# Altium schematic sheet Sheet5.SchDoc
size A; SheetNumber: 6; SheetTotal: 10
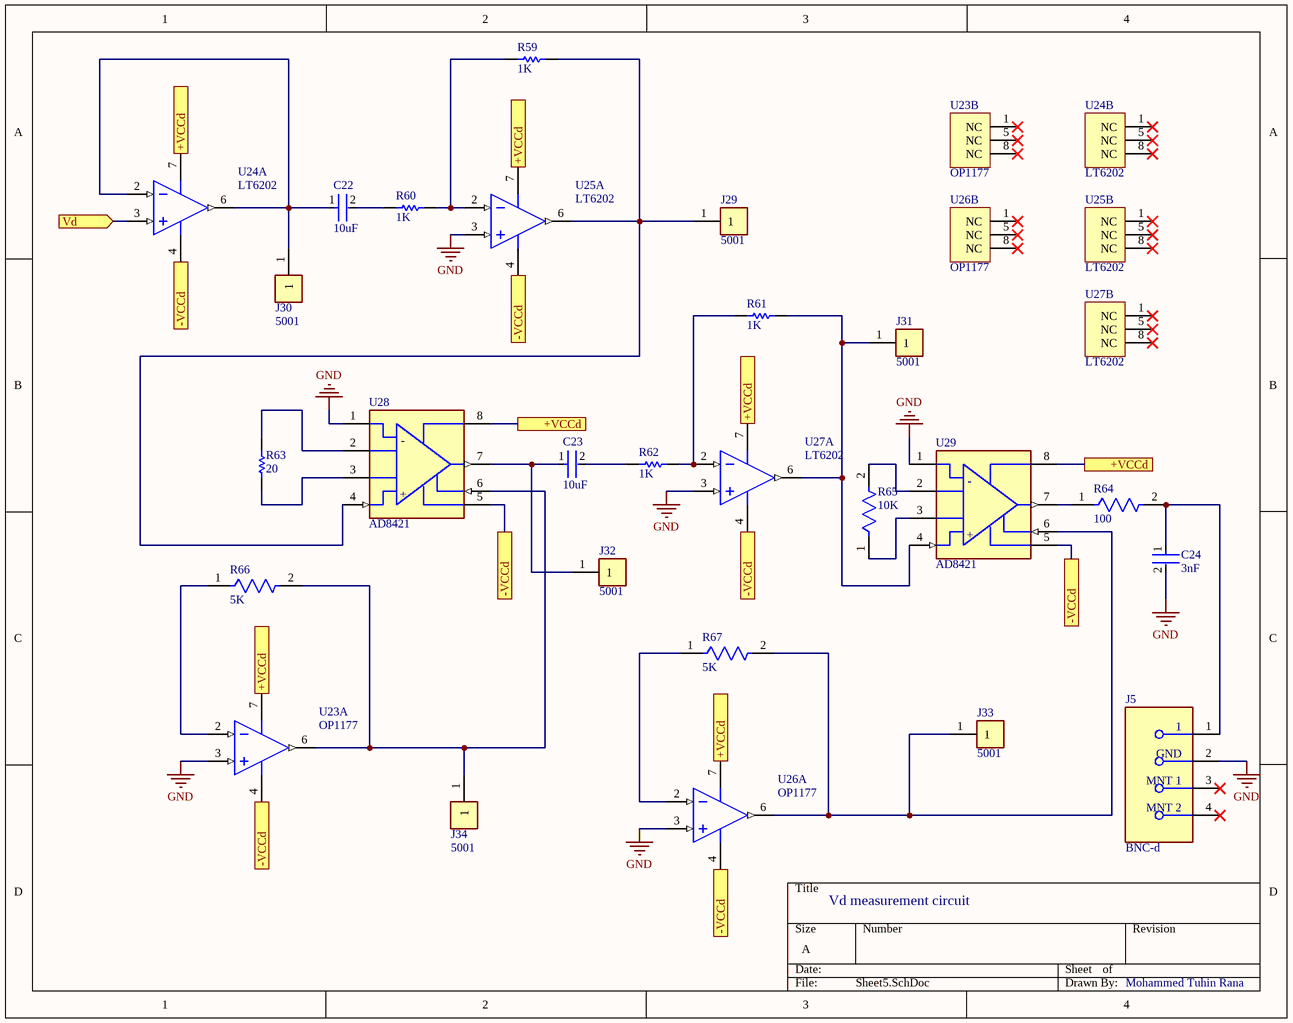
[diagram p0: Sheet5.SchDoc]

## Parts
C22  10uF  [FP-GRM21B-0_1-IPC_C]
C23  10uF  [FP-GRM21B-0_1-IPC_C]
C24  3nF  [FP-C1206C-EB-MFG]
J5  BNC-d  [FP-5413194-2-MFG]
J29  5001  [FP-5001-MFG]
J30  5001  [FP-5001-MFG]
J31  5001  [FP-5001-MFG]
J32  5001  [FP-5001-MFG]
J33  5001  [FP-5001-MFG]
J34  5001  [FP-5001-MFG]
R59  1K  [RESC3216X70X50ML20T25]
R60  1K  [RESC3216X70X50ML20T25]
R61  1K  [RESC3216X70X50ML20T25]
R62  1K  [RESC3216X70X50ML20T25]
R63  20  [RESC3216X60X45ML10T20]
R64  100  [FP-ERA3A-IPC_B]
R65  10K  [FP-ERJPA3-IPC_A]
R66  5K  [FP-RT1206-0_65-MFG]
R67  5K  [FP-RT1206-0_65-MFG]
U23  OP1177  [ADI-R-8_N]  (parts A,B of 2)
U24  LT6202  [LT-S8-8_N]  (parts A,B of 2)
U25  LT6202  [LT-S8-8_N]  (parts A,B of 2)
U26  OP1177  [ADI-R-8_N]  (parts A,B of 2)
U27  LT6202  [LT-S8-8_N]  (parts A,B of 2)
U28  AD8421  [FP-R-8-IPC_C]
U29  AD8421  [FP-R-8-IPC_C]

## Ports
+VCCd (see Sheet5[1A], Sheet5[1C], Sheet5[2A], Sheet5[2B], Sheet5[3B], Sheet5[3C], Sheet10[4B]), +VCCd (see Sheet5[1A], Sheet5[1C], Sheet5[2A], Sheet5[2B], Sheet5[3B], Sheet5[4B], Sheet10[4B]), +VCCd (see Sheet5[1A], Sheet5[1C], Sheet5[2A], Sheet5[2B], Sheet5[3C], Sheet5[4B], Sheet10[4B]), +VCCd (see Sheet5[1A], Sheet5[1C], Sheet5[2A], Sheet5[3B], Sheet5[3C], Sheet5[4B], Sheet10[4B]), +VCCd (see Sheet5[1A], Sheet5[1C], Sheet5[2B], Sheet5[3B], Sheet5[3C], Sheet5[4B], Sheet10[4B]), +VCCd (see Sheet5[1A], Sheet5[2A], Sheet5[2B], Sheet5[3B], Sheet5[3C], Sheet5[4B], Sheet10[4B]), +VCCd (see Sheet5[1C], Sheet5[2A], Sheet5[2B], Sheet5[3B], Sheet5[3C], Sheet5[4B], Sheet10[4B]), -VCCd (see Sheet5[1B], Sheet5[1D], Sheet5[2B], Sheet5[2C], Sheet5[3C], Sheet5[3D], Sheet10[3B]), -VCCd (see Sheet5[1B], Sheet5[1D], Sheet5[2B], Sheet5[2C], Sheet5[3C], Sheet5[4C], Sheet10[3B]), -VCCd (see Sheet5[1B], Sheet5[1D], Sheet5[2B], Sheet5[2C], Sheet5[3D], Sheet5[4C], Sheet10[3B]), -VCCd (see Sheet5[1B], Sheet5[1D], Sheet5[2B], Sheet5[3C], Sheet5[3D], Sheet5[4C], Sheet10[3B]), -VCCd (see Sheet5[1B], Sheet5[1D], Sheet5[2C], Sheet5[3C], Sheet5[3D], Sheet5[4C], Sheet10[3B]), -VCCd (see Sheet5[1B], Sheet5[2B], Sheet5[2C], Sheet5[3C], Sheet5[3D], Sheet5[4C], Sheet10[3B]), -VCCd (see Sheet5[1D], Sheet5[2B], Sheet5[2C], Sheet5[3C], Sheet5[3D], Sheet5[4C], Sheet10[3B]), Vd (in, see Sheet2[4B])

## Nets
GND: C24.2 J5.2(GND) U23.3(+IN) U25.3(+IN) U26.3(+IN) U27.3(+IN) U28.1(-IN) U29.1(-IN)
+VCCd: U23.7(+V) U24.7(V+) U25.7(V+) U26.7(+V) U27.7(V+) U28.8(+VS) U29.8(+VS) ; port +VCCd
-VCCd: U23.4(-V) U24.4(V-) U25.4(V-) U26.4(-V) U27.4(V-) U28.5(-VS) U29.5(-VS) ; port -VCCd
Vd: U24.3(+IN) ; port Vd
NetC22_1: C22.1 J30.1 U24.2(-IN) U24.6(OUT)
NetC22_2: C22.2 R60.1
NetC23_1: C23.1 J32.1 U28.7(VOUT)
NetC23_2: C23.2 R62.1
NetC24_1: C24.1 J5.1 R64.2
NetJ29_1: J29.1 R59.2 U25.6(OUT) U28.4(+IN)
NetJ31_1: J31.1 R61.2 U27.6(OUT) U29.4(+IN)
NetJ33_1: J33.1 R67.2 U26.6(OUT) U29.6(REF)
NetJ34_1: J34.1 R66.2 U23.6(OUT) U28.6(REF)
NetR59_1: R59.1 R60.2 U25.2(-IN)
NetR61_1: R61.1 R62.2 U27.2(-IN)
NetR63_1: R63.1 U28.3(2_RG)
NetR63_2: R63.2 U28.2(1_RG)
NetR64_1: R64.1 U29.7(VOUT)
NetR65_1: R65.1 U29.3(2_RG)
NetR65_2: R65.2 U29.2(1_RG)
NetR66_1: R66.1 U23.2(-IN)
NetR67_1: R67.1 U26.2(-IN)

Not connected (* = marked no-connect by the designer): J5 3(MNT_1)* 4(MNT_2)*; U23 1(NC)* 5(NC)* 8(NC)*; U24 1(NC)* 5(NC)* 8(NC)*; U25 1(NC)* 5(NC)* 8(NC)*; U26 1(NC)* 5(NC)* 8(NC)*; U27 1(NC)* 5(NC)* 8(NC)*

## Notes on the sheet
- Vd measurement circuit
- Mohammed Tuhin Rana
- (in symbol CMP-09116-000012-1) -; +

## Library data of the parts
C22 C23 = CMP-2007-03453-2: Chip Multilayer Ceramic Capacitors for General Purpose, 0805, 10uF, X5R, 15%, 10%, 16V; Radiation Hardening: No; Thickness: 0.053inch; Voltage Rating (DC): 16V; Lead Free: Lead Free; Package Quantity: 1; Width: 1.25mm; Case Code (Imperial): 0805; Depth: 1.25mm; Packaging: Tape and Reel; Dielectric: X5R; Max Operating Temperature: 85°C; Tolerance: 10%; Voltage Rating: 16V; Voltage: 16V; Capacitance: 10uF; Height: 1.25mm; Case Code (Metric): 2012; Material: Ceramic; Mount: Surface Mount; Case/Package: 0805; REACH SVHC: No SVHC; Length: 2mm; Min Operating Temperature: -55°C; Termination: SMD/SMT
C24 = CMP-1037-02920-2: CAP CER 3000PF 50V NP0 1206; Manufacturer Part Number: C1206C302J5GACTU; Manufacturer: KEMET; Value: 3,000 pF; Temperature Coefficient: 15%; Tolerance: 0.05; Material: Ceramic; Automotive Grade: Grade 0; Temperature Characteristic: C0G; ComponentLink2URL: https://content.kemet.com/datasheets/KEM_C1007_X8R_ULTRA_150C_SMD.pdf; Device Class L3: Ceramic Capacitors; Device Class L2: Capacitors; ComponentLink2Description: Datasheet; Automotive: Yes; Temperature Range Low: -55°C; Temperature: -55°C to +150°C; Octopart: https://octopart.com/c1206c302j5gactu-kemet-12776246; Height: 0.88mm; Lead Free: Yes; Device Class L1: Passive Components; Digikey Description: CAP CER 3000PF 50V NP0 1206; Category: Cap; Mouser Description: Capacitor, Ceramic, 3Nf, 50Vdc, 5-% Tol, 5+% Tol, C0g-Tc Code, -30, 30Ppm-Tc Rohs Compliant: Yes; RoHS: TRUE; Ipc Land Pattern Name: CAPC320160X78; Voltage Rating: 50 V; Capacitance: 3,000 pF; Temperature Range High: +150°C; Package: C1206C-EB
J5 = CMP-03790-39547162-1: 5413194-2 RF BNC Connector, 1 Contact(s), Female, Panel Mount, Solder Terminal, Locking, Jack; Manufacturer Lifecycle Status: ACTIVE; Impedance: 75Ω; Number of Positions: 1; Outside Diameter: 14.529mm; Polarity: Normal, Standard; Sealable: No; Dielectric Material: Polymethylpentene; PCB Mounting Orientation: Right Angle; Voltage Rating: 500V; Body Plating: Nickel; Frequency: 2GHz; Tail Length: 4.11mm; Insulation Resistance: 5GΩ; Body Material: Zinc; ELV: Compliant; Lead Free: Lead Free; Radiation Hardening: No; Gender: Female; Color: Black; Mount: Panel, Through Hole; Packaging: Bulk; NexarPartId: 39547162; Housing Color: Black; Fastening Type: Bayonet; Contact Gender: Female; Lifecycle Status: Production; Depth: 34.93mm; Min Operating Temperature: -55°C; Number of Contacts: 1; RoHS: Compliant; Length: 14.76mm; Insulation Material: Polymethylpentene; Termination: Solder, Through Hole; Connector Type: BNC; Contact Plating: Gold; Max Frequency: 2GHz; Max Operating Temperature: 85°C; Height: 13.18mm; REACH SVHC: Unknown; Orientation: Right Angle; Contact Material: Copper
J29-J34 = CMP-2000-05181-2: PC TEST POINT MINIATURE BLACK; Body Material: Bronze; Plating: Silver; Inside Diameter: 1.27mm; Hole Diameter: 1.6mm; Number of Ports: 1; Outside Diameter: 2.54mm; Insulation: Insulated; Insulation Material: Nylon; Mount: Through Hole; RoHS Compliant: Yes; Series: THM; Height: 0.3inch; Termination: Through Hole; Material: Nylon; Packaging: Bulk; Contact Material: Bronze; REACH SVHC: No SVHC; Contact Plating: Silver; Orientation: Straight; Lead Free: Lead Free; Package Quantity: 100; Length: 7.62mm; Flammability Rating: UL94 V-0; Number of Contacts: 1; Diameter: 2.54mm; Housing Color: Black; Color: Black
R59-R62 = CMP-2003-04406-1: Part Number: ERA8AEB102V; Manufacturer: Panasonic
R63 = CMP-2003-01944-1: Manufacturer: Vishay Dale; Part Number: CRCW120620R0FKEA
R64 = CMP-2000-00870-2: RES SMD 100 OHM 0.1% 1/10W 0603; Voltage Rating: 75V; Power Rating: 100mW; Resistance: 100R; Temperature Coefficient: 25ppm/°C; Number of Terminations: 2; Case/Package: 0603; Termination: SMD/SMT; Number of Pins: 2; Size Code: 0603; Length: 1.6mm; Min Operating Temperature: -55°C; Resistor Type: Thin Film; Depth: 0.8mm; Military Standard: Not; Packaging: Tape and Reel; RoHS Compliant: Yes; Construction: Rectangular; Resistance Tolerance: 0.1%; Contact Plating: Tin; Width: 0.8mm; Mount: Surface Mount; Case Code (Metric): 1608; Max Operating Temperature: 155°C; Height: 0.45mm; Case Code (Imperial): 0603; Series: ERA-3A; Package Quantity: 5000; REACH SVHC: No SVHC; Tolerance: 0.1%; Max Power Dissipation: 100mW; Radiation Hardening: No; Technology: METAL FILM
R65 = CMP-05422-000155-1: RES SMD 10K OHM 1% 1/3W 0603; RoHS Compliant: Yes
R66 R67 = CMP-03412-001731-1: RES SMD 5K OHM 0.1% 1/4W 1206; Manufacturer: Yageo; Manufacturer Part Number: RT1206BRD075KL; Resistance: 5kΩ; Value: 5kΩ; Power Rating: 0.25W; Voltage Rating: 200V; Temperature Coefficient: 25ppm/°C; Series: RT; Mouser Description: Thin Film Resistors - SMD 1/4W 5K ohm .1% 25ppm; Temperature: -55°C to +155°C; Composition: Thin Film; Footprint Url: https://www.yageo.com/upload/website/yageo_PYu-R_Mount_10_19050818_343.pdf; Device Class L1: Passive Components; Temperature Range High: +155°C; Octopart: https://octopart.com/rt1206brd075kl-yageo-29806230; Ipc Land Pattern Name: RESC310160X55; Device Class L3: Chip SMD Resistors; Temperature Range Low: -55°C; Height: 0.65mm; ComponentLink2URL: https://www.yageo.com/upload/media/product/productsearch/datasheet/rchip/PYu-RT_1-to-0.01_RoHS_L_11.pdf; Automotive: No; Category: Res; ComponentLink2Description: Datasheet; Package: RT1206-0.65; Lead Free: Yes; Digikey Description: RES SMD 5K OHM 0.1% 1/4W 1206; Device Class L2: Resistors; RoHS: TRUE; Tolerance: 0.1%
U23 U26 = CMP-0384-00640-2: Single Channel Wide Bandwidth Operational Amplifier, 1.3 MHz BW, 700 mV/us SR, Industrial, 8-pin SOIC (R-8), Reel; PartNumber: OP1177ARZ-REEL7; Manufacturer: Analog Devices; Iq/Amp: 500uA; V Span Max: 36V; Input Bias Current: 500pA; Amplifiers Per Package: 1; Small Signal Bandwidth: 1.3MHz; V Span Min: 5V; Input Offset Voltage: 15uV; ComponentLink2Description: Datasheet; ComponentLink4URL: http://www.analog.com/en/all-operational-amplifiers-op-amps/operational-amplifiers-op-amps/op1177/products/product.html#product-recommendations; ComponentLink3Description: Package Specification; PackageDescription: 8-Pin Standard Small Outline Package, Body 3.9 x 4.9 mm, Pitch 1.27 mm; ComponentLink1URL: http://www.analog.com/en/index.html; PackageReference: R-8; PackageVersion: 060506-A; DatasheetVersion: Rev. G; ComponentLink4Description: Reference Circuit; ComponentLink1Description: Manufacturer URL; Mounting Technology: Surface Mount; RevisionNote: Reference Circuit URL fixed; ComponentLink3URL: http://www.analog.com/static/imported-files/packages/PKG_PDF/SOIC_Narrow%20(R)/R_8.pdf; Code_JEDEC: MS-012-AA; Slew Rate: 700mV/us; ComponentLink2URL: http://www.analog.com/static/imported-files/data_sheets/OP1177_2177_4177.pdf; Generic Part Number: OP1177
U24 U25 U27 = CMP-0359-02644-2: Single Channel, Low Noise, High Speed Operational Amplifier, RRIO, 100 MHz Typical GBW, 25 V/us Typical SR, 2.5 to 12.6 V, 8-Pin SOIC (S8-8), Commercial, Pb-Free; Manufacturer: Linear Technology; PartNumber: LT6202CS8#PBF; Channels (#): 1; Vs Min (V): 2.5; Is (mA) Typical: 2.8; Vos (mV) Typical: 0.1; Vos (mV) Guaranteed: 0.5; GBW (MHz) Typical: 100; Vs Max (V): 12.6; SR (V/us) Typical: 25; RevisionNote: URLs updated; ComponentLink2URL: http://cds.linear.com/docs/en/datasheet/620234fd.pdf; PackageDescription: 8-Pin Plastic Small Outline, Body 4.9 x 3.9 mm, Pitch 1.27 mm; Linear Technology Part Number: LT6202; RoHS: Pb-Free; ComponentLink3Description: Package Specification; ComponentLink2Description: Datasheet; PackageVersion: Rev G; ComponentLink3URL: http://cds.linear.com/docs/en/packaging/05081610_G_SO8.pdf; ComponentLink1Description: Manufacturer URL; DatasheetVersion: Rev. D; PackageReference: LT-S8-8; Mounting Technology: Surface Mount; ComponentLink1URL: http://www.linear.com/; Type: VFB
U28 U29 = CMP-09116-000012-1: IC OPAMP INSTR 10MHZ 8SOIC; Manufacturer: Analog Devices; Manufacturer Part Number: AD8421ARZ-R7; Number Of Channels: 1; Min Supply Voltage: 5V; Max Dual Supply Voltage: 18V; Input Offset Voltage: 0.07mV; Standoff Height: 0.1mm; Min Dual Supply Voltage: 2.5V; Nominal Supply Current: 2mA; Max Supply Voltage: 36V; Input Bias Current: 0.001uA; Max Junction Temp: +150°C; Lead Free: Yes; Temperature: -40°C to +85°C; Device Class L1: Integrated Circuits (ICs); Temperature Range Low: -40°C; Automotive: No; RoHS: TRUE; Bandwidth: 10MHz; Package: R-8; Temperature Range High: +85°C; Octopart: https://octopart.com/ad8421arz-r7-analog+devices-21054779; Digikey Description: IC OPAMP INSTR 10MHZ 8SOIC; Device Class L2: Linear ICs; ComponentLink2Description: Datasheet; Category: IC; ComponentLink2URL: https://www.analog.com/media/en/technical-documentation/data-sheets/AD8421.pdf; Height: 1.75mm; Mouser Description: Instrumentation Amplifiers 3nV/Hz Low Power; Device Class L3: Instrumentation